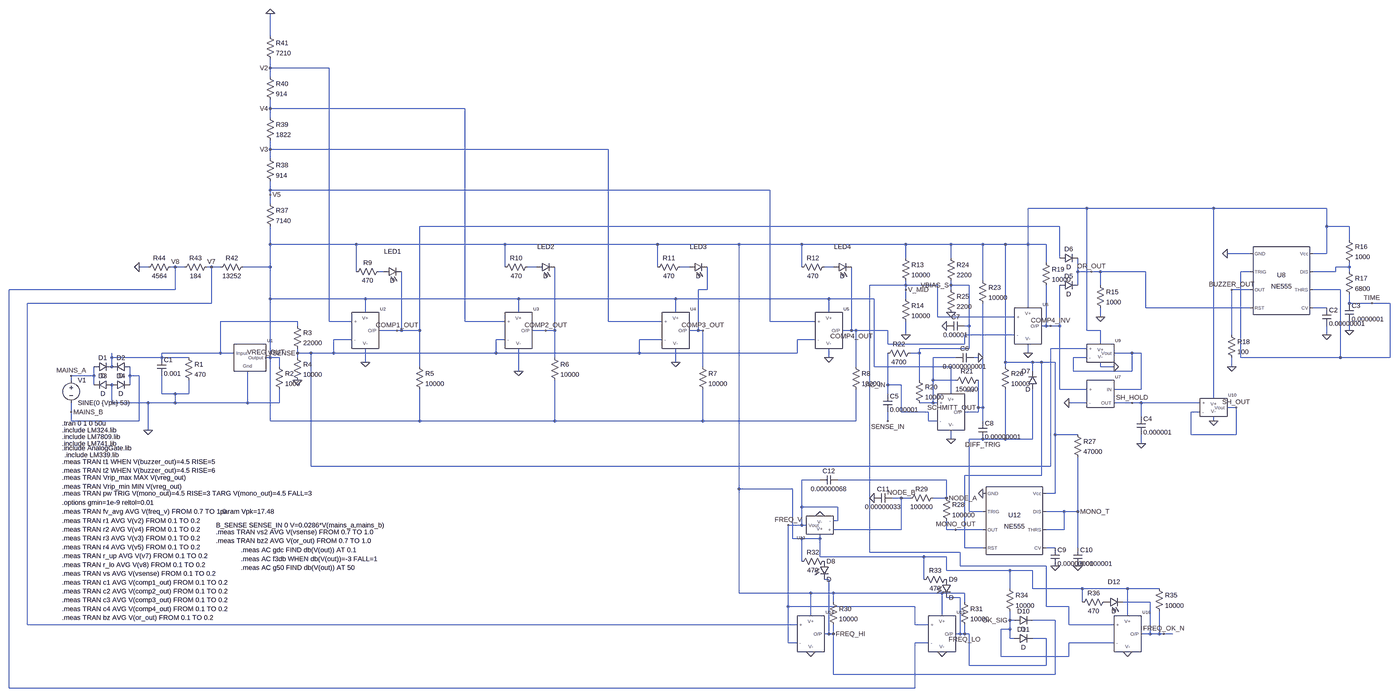
[diagram p0: schematic LIC_LabProject.asc, whole sheet]
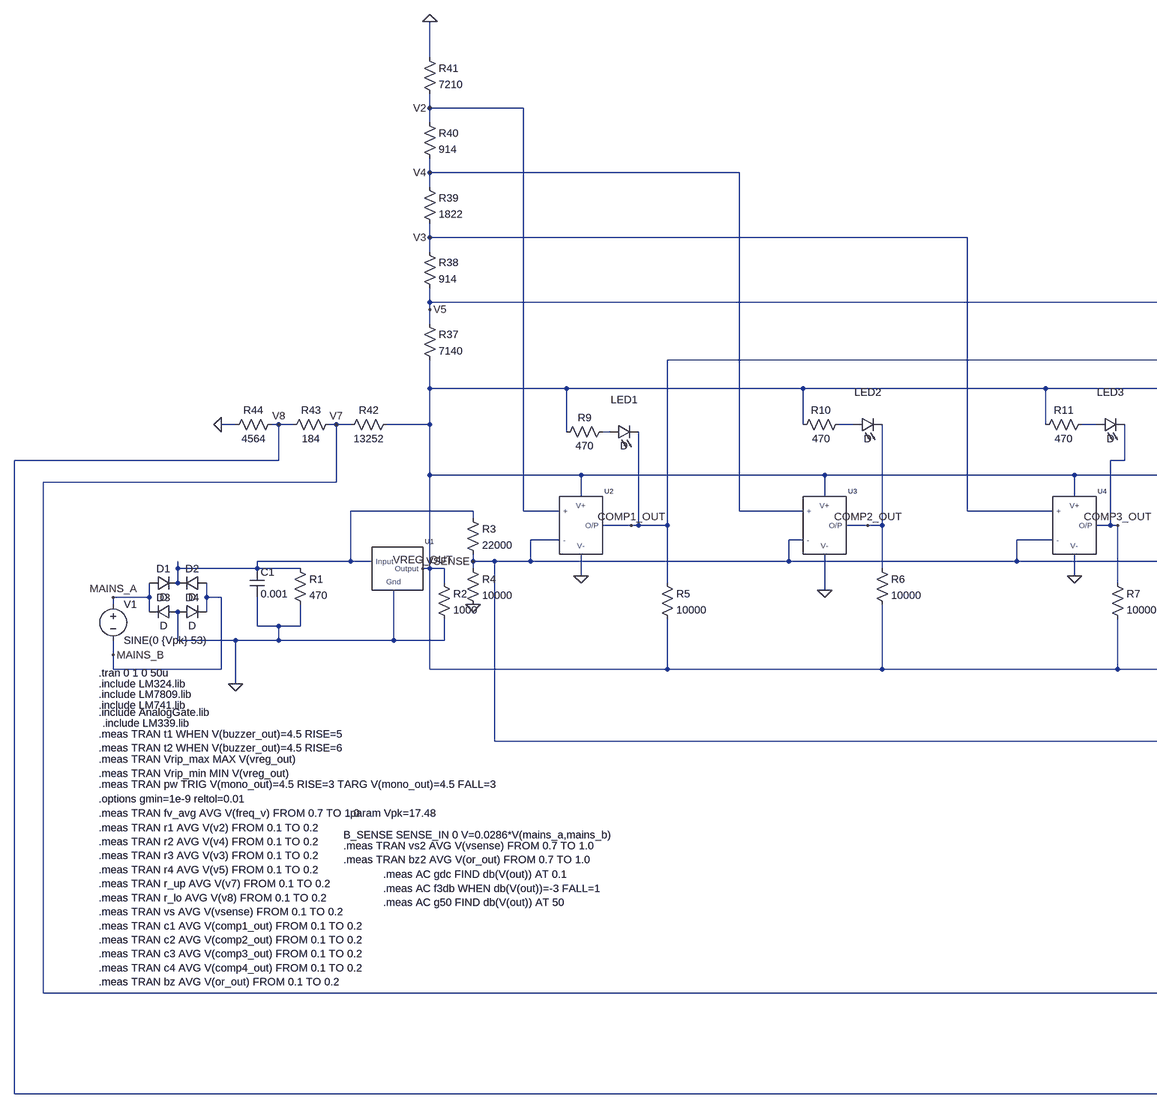
[diagram p1: schematic LIC_LabProject.asc, part, row 1 of 1, column 1 of 2]
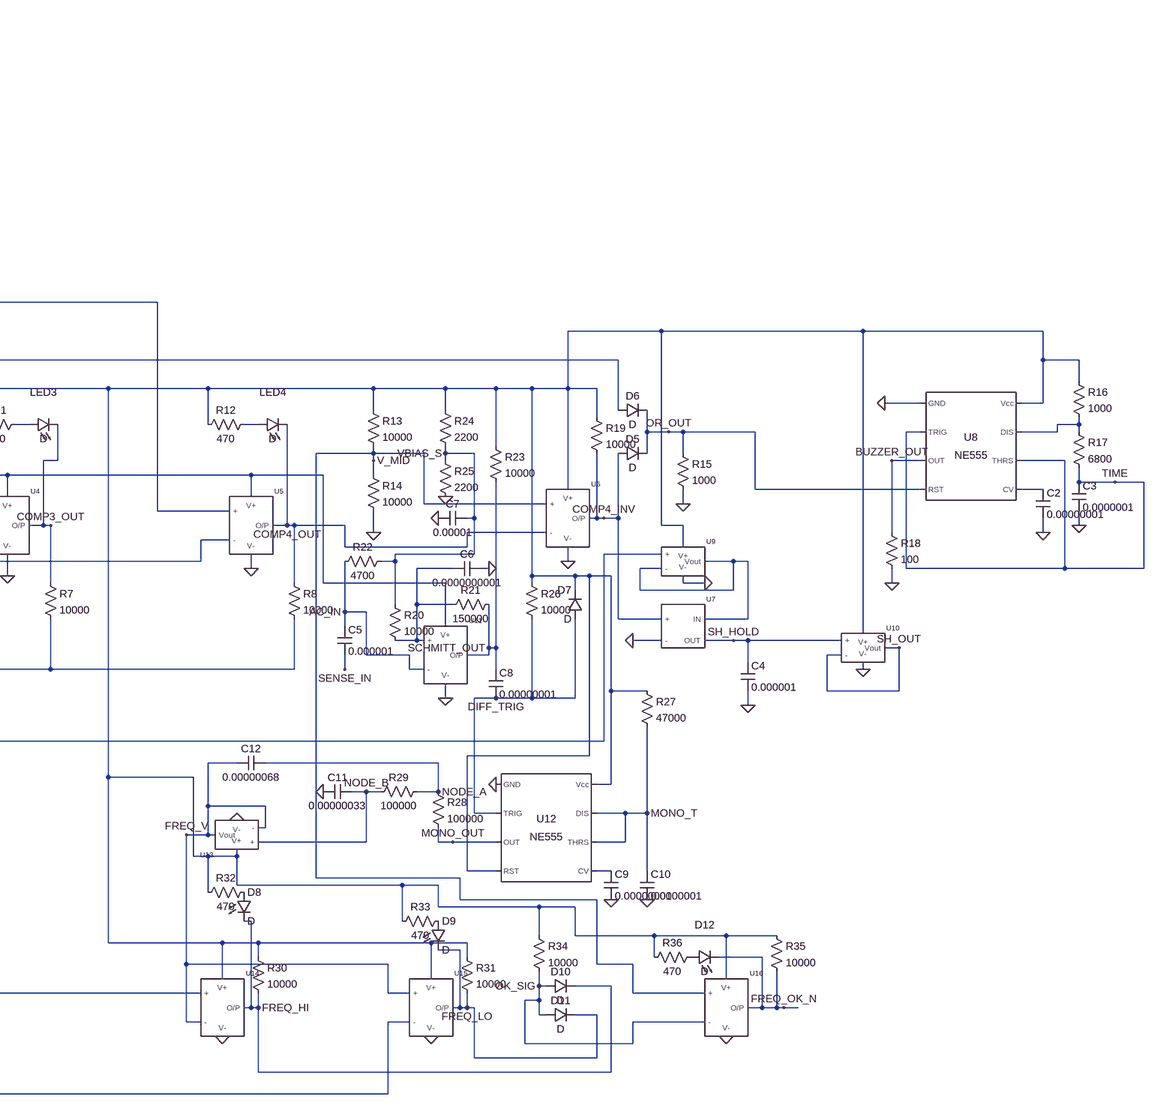
[diagram p2: schematic LIC_LabProject.asc, part, row 1 of 1, column 2 of 2]
LIC_LabProject.asc, the LTspice schematic file:
Version 4.1
SHEET 1 4772 1204
WIRE 736 -1104 736 -1184
WIRE 736 -992 736 -1024
WIRE 944 -992 736 -992
WIRE 736 -960 736 -992
WIRE 736 -848 736 -880
WIRE 1424 -848 736 -848
WIRE 736 -816 736 -848
WIRE 736 -704 736 -736
WIRE 1984 -704 736 -704
WIRE 736 -672 736 -704
WIRE 736 -560 736 -592
WIRE 2576 -560 736 -560
WIRE 736 -544 736 -560
WIRE 736 -512 736 -544
WIRE 3696 -496 3488 -496
WIRE 4144 -496 3696 -496
WIRE 4544 -496 4144 -496
WIRE 3600 -432 1264 -432
WIRE 4544 -432 4544 -496
WIRE 4624 -432 4544 -432
WIRE 4624 -384 4624 -432
WIRE 736 -368 736 -432
WIRE 1040 -368 736 -368
WIRE 1584 -368 1040 -368
WIRE 2160 -368 1584 -368
WIRE 2448 -368 2160 -368
WIRE 2688 -368 2448 -368
WIRE 3056 -368 2688 -368
WIRE 3216 -368 3056 -368
WIRE 3328 -368 3216 -368
WIRE 3408 -368 3328 -368
WIRE 3488 -368 3488 -496
WIRE 3488 -368 3408 -368
WIRE 3552 -368 3488 -368
WIRE 4272 -336 4192 -336
WIRE 4544 -336 4544 -432
WIRE 4544 -336 4496 -336
WIRE 3056 -320 3056 -368
WIRE 3216 -320 3216 -368
WIRE 3600 -320 3600 -432
WIRE 3552 -304 3552 -368
WIRE 304 -288 272 -288
WIRE 400 -288 384 -288
WIRE 432 -288 400 -288
WIRE 528 -288 512 -288
WIRE 560 -288 528 -288
WIRE 736 -288 736 -368
WIRE 736 -288 640 -288
WIRE 1584 -288 1584 -368
WIRE 1696 -288 1664 -288
WIRE 2160 -288 2160 -368
WIRE 2272 -288 2240 -288
WIRE 2688 -288 2688 -368
WIRE 2800 -288 2768 -288
WIRE 4624 -288 4624 -304
WIRE 4624 -288 4576 -288
WIRE 1040 -272 1040 -368
WIRE 1136 -272 1120 -272
WIRE 3664 -272 3664 -320
WIRE 3712 -272 3664 -272
WIRE 3744 -272 3712 -272
WIRE 3904 -272 3744 -272
WIRE 4272 -272 4240 -272
WIRE 4576 -272 4576 -288
WIRE 4576 -272 4496 -272
WIRE 4624 -272 4624 -288
WIRE 3328 -240 3328 -368
WIRE 3056 -224 3056 -240
WIRE 3056 -224 2928 -224
WIRE 3168 -224 3056 -224
WIRE 3216 -224 3216 -240
WIRE 3280 -224 3216 -224
WIRE 3664 -224 3664 -272
WIRE 3744 -224 3744 -272
WIRE 400 -208 400 -288
WIRE 400 -208 -256 -208
WIRE 2336 -208 2336 -288
WIRE 2336 -208 2304 -208
WIRE 3056 -208 3056 -224
WIRE 3216 -208 3216 -224
WIRE 4272 -208 4208 -208
WIRE 4592 -208 4496 -208
WIRE 736 -176 736 -288
WIRE 1072 -176 736 -176
WIRE 1632 -176 1072 -176
WIRE 2224 -176 1632 -176
WIRE 2784 -176 2224 -176
WIRE 2944 -176 2784 -176
WIRE 3056 -176 3056 -208
WIRE 528 -160 528 -288
WIRE 528 -160 -192 -160
WIRE 4624 -160 4624 -192
WIRE 4704 -160 4624 -160
WIRE 4768 -160 4704 -160
WIRE 3488 -144 3488 -368
WIRE 3904 -144 3904 -272
WIRE 4272 -144 3904 -144
WIRE 4544 -144 4496 -144
WIRE 1072 -128 1072 -176
WIRE 1632 -128 1632 -176
WIRE 2224 -128 2224 -176
WIRE 2784 -128 2784 -176
WIRE 3168 -112 3168 -224
WIRE 3440 -112 3168 -112
WIRE 3744 -112 3744 -144
WIRE 832 -96 560 -96
WIRE 944 -96 944 -992
WIRE 1024 -96 944 -96
WIRE 1424 -96 1424 -848
WIRE 1584 -96 1424 -96
WIRE 1984 -96 1984 -704
WIRE 2176 -96 1984 -96
WIRE 2576 -96 2576 -560
WIRE 2736 -96 2576 -96
WIRE 832 -80 832 -96
WIRE 3280 -80 3280 -224
WIRE 3280 -80 3264 -80
WIRE 3552 -80 3552 -224
WIRE 3552 -80 3536 -80
WIRE 3568 -80 3552 -80
WIRE 3600 -80 3600 -224
WIRE 3600 -80 3568 -80
WIRE 1184 -64 1120 -64
WIRE 1200 -64 1200 -272
WIRE 1200 -64 1184 -64
WIRE 1264 -64 1264 -432
WIRE 1264 -64 1200 -64
WIRE 1728 -64 1680 -64
WIRE 1760 -64 1760 -288
WIRE 1760 -64 1728 -64
WIRE 2304 -64 2304 -208
WIRE 2304 -64 2272 -64
WIRE 2320 -64 2304 -64
WIRE 2864 -64 2864 -288
WIRE 2864 -64 2832 -64
WIRE 2880 -64 2864 -64
WIRE 2992 -64 2880 -64
WIRE 3696 -64 3696 -496
WIRE 3744 -64 3696 -64
WIRE 4624 -64 4624 -96
WIRE 3056 -48 3056 -96
WIRE 3440 -48 3264 -48
WIRE 4208 -48 4208 -208
WIRE 4544 -48 4544 -80
WIRE 1024 -32 960 -32
WIRE 1584 -32 1552 -32
WIRE 2176 -32 2096 -32
WIRE 2736 -32 2672 -32
WIRE 2992 -16 2992 -64
WIRE 3264 -16 3264 -48
WIRE 3264 -16 2992 -16
WIRE 3744 -16 3744 -64
WIRE 3280 0 3280 -80
WIRE 3280 0 3104 0
WIRE 3696 0 3568 0
WIRE 560 16 560 -96
WIRE 560 16 352 16
WIRE 608 16 560 16
WIRE 832 16 832 0
WIRE 880 16 832 16
WIRE 960 16 960 -32
WIRE 960 16 880 16
WIRE 1552 16 1552 -32
WIRE 1552 16 960 16
WIRE 2096 16 2096 -32
WIRE 2096 16 1552 16
WIRE 2672 16 2672 -32
WIRE 2672 16 2096 16
WIRE 3104 16 3104 0
WIRE 3104 16 3072 16
WIRE 3488 16 3488 -16
WIRE 3856 16 3792 16
WIRE 3888 16 3856 16
WIRE 176 32 176 16
WIRE 352 32 352 16
WIRE 352 32 176 32
WIRE 448 32 352 32
WIRE 736 32 736 -176
WIRE 736 32 720 32
WIRE 768 32 736 32
WIRE 832 32 832 16
WIRE 1760 32 1760 -64
WIRE 2784 32 2784 0
WIRE 3232 32 3152 32
WIRE 3312 32 3296 32
WIRE 3696 32 3648 32
WIRE 4240 32 4240 -272
WIRE 4592 32 4592 -208
WIRE 4592 32 4240 32
WIRE 4768 32 4768 -160
WIRE 4768 32 4592 32
WIRE 1072 48 1072 0
WIRE 2224 48 2224 0
WIRE 3408 48 3408 -368
WIRE 3504 48 3408 48
WIRE 3536 48 3504 48
WIRE 3584 48 3536 48
WIRE 176 64 176 32
WIRE 768 64 768 32
WIRE 1264 64 1264 -64
WIRE 2320 64 2320 -64
WIRE 2880 64 2880 -64
WIRE 2944 64 2944 -176
WIRE 3216 64 2944 64
WIRE 3408 64 3408 48
WIRE 3744 64 3744 48
WIRE 3792 64 3744 64
WIRE 4208 64 4208 32
WIRE 1632 80 1632 0
WIRE 3504 80 3504 48
WIRE 3648 80 3648 32
WIRE 3856 80 3856 16
WIRE 3856 80 3648 80
WIRE 112 96 112 64
WIRE 112 96 32 96
WIRE 240 96 240 64
WIRE 272 96 240 96
WIRE 32 112 32 96
WIRE 3104 112 3104 16
WIRE 3152 112 3152 32
WIRE 3232 112 3152 112
WIRE 112 128 112 96
WIRE 240 128 240 96
WIRE 2992 128 2992 16
WIRE 3040 128 2992 128
WIRE 3600 144 3600 -80
WIRE 3696 144 3600 144
WIRE 3888 144 3888 16
WIRE 3888 144 3792 144
WIRE 352 160 352 96
WIRE 400 160 352 160
WIRE 448 160 448 112
WIRE 448 160 400 160
WIRE 2992 160 2992 128
WIRE 3216 160 3216 64
WIRE 4144 176 4144 -496
WIRE 176 192 176 128
WIRE 304 192 176 192
WIRE 400 192 400 160
WIRE 400 192 304 192
WIRE 656 192 656 80
WIRE 656 192 400 192
WIRE 768 192 768 144
WIRE 768 192 656 192
WIRE 3152 192 3152 112
WIRE 3152 192 3104 192
WIRE 3168 192 3152 192
WIRE 3696 192 3632 192
WIRE 3856 192 3792 192
WIRE 3888 192 3856 192
WIRE 4096 192 3888 192
WIRE 3312 208 3312 112
WIRE 3328 208 3328 -160
WIRE 3328 208 3312 208
WIRE 4224 208 4192 208
WIRE 32 224 32 192
WIRE 3040 224 3040 128
WIRE 3136 224 3040 224
WIRE 3312 224 3312 208
WIRE 3312 224 3264 224
WIRE 4096 224 4064 224
WIRE 3888 240 3888 192
WIRE 32 256 32 224
WIRE 272 256 272 96
WIRE 272 256 32 256
WIRE 736 256 736 32
WIRE 1264 256 1264 144
WIRE 1264 256 736 256
WIRE 1760 256 1760 112
WIRE 1760 256 1264 256
WIRE 2320 256 2320 144
WIRE 2320 256 1760 256
WIRE 2880 256 2880 144
WIRE 2880 256 2320 256
WIRE 2992 256 2992 224
WIRE 3136 256 3136 224
WIRE 3168 256 3136 256
WIRE 3328 256 3328 208
WIRE 4144 256 4144 240
WIRE 304 288 304 192
WIRE 3584 304 3584 48
WIRE 3664 304 3584 304
WIRE 4064 304 4064 224
WIRE 4224 304 4224 208
WIRE 4224 304 4064 304
WIRE 3216 320 3216 288
WIRE 3328 320 3280 320
WIRE 3408 320 3408 144
WIRE 3408 320 3328 320
WIRE 3504 320 3504 144
WIRE 3504 320 3408 320
WIRE 3888 336 3888 304
WIRE 880 416 880 16
WIRE 3568 416 3568 0
WIRE 3568 416 880 416
WIRE 3536 448 3536 48
WIRE 3536 448 3264 448
WIRE 2752 464 2688 464
WIRE 3200 464 2816 464
WIRE 2448 496 2448 -368
WIRE 2656 496 2448 496
WIRE 3584 512 3584 304
WIRE 3584 512 3552 512
WIRE 3040 528 3008 528
WIRE 3072 528 3040 528
WIRE 3200 528 3200 464
WIRE 3200 528 3152 528
WIRE 2688 560 2688 464
WIRE 2816 560 2688 560
WIRE 3280 576 3280 320
WIRE 3328 576 3280 576
WIRE 3616 576 3552 576
WIRE 3664 576 3664 384
WIRE 3664 576 3616 576
WIRE 2816 608 2816 560
WIRE 2816 608 2800 608
WIRE 2688 624 2688 560
WIRE 2688 624 2640 624
WIRE 2704 624 2688 624
WIRE 3040 640 3040 528
WIRE 3040 640 2800 640
WIRE 3200 640 3200 608
WIRE 3232 640 3200 640
WIRE 3328 640 3232 640
WIRE 3616 640 3616 576
WIRE 3616 640 3552 640
WIRE 2656 672 2656 496
WIRE 2688 672 2656 672
WIRE 2752 672 2752 656
WIRE 2752 672 2688 672
WIRE 3264 704 3264 448
WIRE 3328 704 3264 704
WIRE 3584 704 3552 704
WIRE 3664 704 3664 576
WIRE 2928 720 2928 -224
WIRE 3248 720 2928 720
WIRE 2752 736 2752 672
WIRE 3120 736 2752 736
WIRE 3200 736 3120 736
WIRE 2688 752 2688 672
WIRE 3248 768 3248 720
WIRE 3552 768 3248 768
WIRE 3200 784 3200 736
WIRE 3424 784 3200 784
WIRE 3504 784 3424 784
WIRE 2784 816 2768 816
WIRE 3120 816 3120 736
WIRE 3424 848 3424 784
WIRE 3504 848 3504 784
WIRE 3680 848 3504 848
WIRE 3840 848 3680 848
WIRE 3952 848 3840 848
WIRE 2448 864 2448 496
WIRE 2720 864 2448 864
WIRE 2800 864 2720 864
WIRE 3184 864 2800 864
WIRE 3264 864 3184 864
WIRE 3248 880 3200 880
WIRE 2800 896 2800 864
WIRE 3264 896 3264 864
WIRE 3680 896 3680 848
WIRE 3920 896 3824 896
WIRE 2640 912 2640 624
WIRE 3088 912 2640 912
WIRE 3552 912 3552 768
WIRE 3632 912 3552 912
WIRE 2720 944 2720 864
WIRE 3184 944 3184 864
WIRE 3840 944 3840 848
WIRE 3424 960 3424 928
WIRE 3440 960 3424 960
WIRE 3584 960 3504 960
WIRE -192 976 -192 -160
WIRE 2672 976 -192 976
WIRE 3088 976 3088 912
WIRE 3136 976 3088 976
WIRE 3632 976 3632 912
WIRE 3792 976 3632 976
WIRE 3424 992 3424 960
WIRE 3424 992 3392 992
WIRE 2784 1008 2784 816
WIRE 2784 1008 2768 1008
WIRE 2800 1008 2800 976
WIRE 2800 1008 2784 1008
WIRE 3248 1008 3248 880
WIRE 3248 1008 3232 1008
WIRE 3264 1008 3264 976
WIRE 3264 1008 3248 1008
WIRE 3280 1008 3264 1008
WIRE 3920 1008 3920 896
WIRE 3920 1008 3888 1008
WIRE 3952 1008 3952 928
WIRE 3952 1008 3920 1008
WIRE 3968 1008 3952 1008
WIRE 4000 1008 3968 1008
WIRE 3424 1024 3424 992
WIRE 3440 1024 3424 1024
WIRE 3552 1024 3504 1024
WIRE 2640 1040 2640 912
WIRE 2672 1040 2640 1040
WIRE 3136 1040 3088 1040
WIRE 3792 1040 3632 1040
WIRE 3392 1088 3392 992
WIRE 3632 1088 3632 1040
WIRE 3632 1088 3392 1088
WIRE 3280 1120 3280 1008
WIRE 3552 1120 3552 1024
WIRE 3552 1120 3280 1120
WIRE 2800 1152 2800 1008
WIRE 3584 1152 3584 960
WIRE 3584 1152 2800 1152
WIRE -256 1200 -256 -208
WIRE 3088 1200 3088 1040
WIRE 3088 1200 -256 1200
FLAG 304 288 0
FLAG 832 112 0
FLAG 832 16 VSENSE
FLAG 1072 48 0
FLAG 1184 -64 COMP1_OUT
FLAG 720 32 VREG_OUT
FLAG 1632 80 0
FLAG 1728 -64 COMP2_OUT
FLAG 2784 32 0
FLAG 2224 48 0
FLAG 2320 -64 COMP3_OUT
FLAG 2864 -64 COMP4_OUT
FLAG 3056 -48 0
FLAG 3056 -208 V_MID
FLAG 3488 16 0
FLAG 3568 -80 COMP4_INV
FLAG 3744 -112 0
FLAG 3712 -272 OR_OUT
FLAG 4192 -336 0
FLAG 4544 -48 0
FLAG 4208 64 0
FLAG 4624 -64 0
FLAG 4704 -160 TIME
FLAG 4208 -208 BUZZER_OUT
FLAG 3632 192 0
FLAG 3792 64 0
FLAG 3856 192 SH_HOLD
FLAG 3888 336 0
FLAG 4144 256 0
FLAG 4224 208 SH_OUT
FLAG 2992 128 AC_IN
FLAG 3312 208 SCHMITT_OUT
FLAG 3216 320 0
FLAG 3312 32 0
FLAG 3216 -128 0
FLAG 3216 -224 VBIAS_S
FLAG 3200 -80 0
FLAG 3232 640 MONO_OUT
FLAG 3328 320 DIFF_TRIG
FLAG 3584 768 0
FLAG 3328 512 0
FLAG 3664 768 0
FLAG 3664 576 MONO_T
FLAG 3200 528 NODE_A
FLAG 3040 528 NODE_B
FLAG 2944 528 0
FLAG 2640 624 FREQ_V
FLAG 2752 592 0
FLAG 2720 1072 0
FLAG 3184 1072 0
FLAG 2800 1008 FREQ_HI
FLAG 3264 1008 FREQ_LO
FLAG 3424 960 OK_SIG
FLAG 3840 1072 0
FLAG 3968 1008 FREQ_OK_N
FLAG 736 -1184 0
FLAG 736 -544 V5
FLAG 736 -704 V3
FLAG 736 -848 V4
FLAG 736 -992 V2
FLAG 272 -288 0
FLAG 528 -288 V7
FLAG 400 -288 V8
FLAG 32 96 MAINS_A
FLAG 32 224 MAINS_B
FLAG 2992 256 SENSE_IN
SYMBOL voltage 32 96 R0
WINDOW 123 0 0 Left 0
WINDOW 39 0 0 Left 0
SYMATTR InstName V1
SYMATTR Value SINE(0 {Vpk} 53)
SYMBOL diode 112 80 R270
WINDOW 0 32 32 VTop 2
WINDOW 3 0 32 VBottom 2
SYMATTR InstName D1
SYMBOL diode 240 48 R90
WINDOW 0 0 32 VBottom 2
WINDOW 3 32 32 VTop 2
SYMATTR InstName D2
SYMBOL diode 176 112 R90
WINDOW 0 0 32 VBottom 2
WINDOW 3 32 32 VTop 2
SYMATTR InstName D3
SYMBOL diode 176 144 R270
WINDOW 0 32 32 VTop 2
WINDOW 3 0 32 VBottom 2
SYMATTR InstName D4
SYMBOL cap 336 32 R0
SYMATTR InstName C1
SYMATTR Value 0.001
SYMBOL res 432 16 R0
SYMATTR InstName R1
SYMATTR Value 470
SYMBOL LM7809 656 32 R0
SYMATTR InstName U1
SYMBOL res 816 -96 R0
SYMATTR InstName R3
SYMATTR Value 22000
SYMBOL res 816 16 R0
SYMATTR InstName R4
SYMATTR Value 10000
SYMBOL LM339 1072 -64 R0
SYMATTR InstName U2
SYMBOL LM339 1632 -64 R0
SYMATTR InstName U3
SYMBOL res 1744 16 R0
SYMATTR InstName R6
SYMATTR Value 10000
SYMBOL res 752 48 R0
SYMATTR InstName R2
SYMATTR Value 1000
SYMBOL res 1248 48 R0
SYMATTR InstName R5
SYMATTR Value 10000
SYMBOL LM339 2224 -64 R0
SYMATTR InstName U4
SYMBOL LM339 2784 -64 R0
SYMATTR InstName U5
SYMBOL res 2304 48 R0
SYMATTR InstName R7
SYMATTR Value 10000
SYMBOL res 2864 48 R0
SYMATTR InstName R8
SYMATTR Value 10000
SYMBOL res 1136 -288 R90
WINDOW 0 0 56 VBottom 2
WINDOW 3 32 56 VTop 2
SYMATTR InstName R9
SYMATTR Value 470
SYMBOL res 1680 -304 R90
WINDOW 0 0 56 VBottom 2
WINDOW 3 32 56 VTop 2
SYMATTR InstName R10
SYMATTR Value 470
SYMBOL res 2256 -304 R90
WINDOW 0 0 56 VBottom 2
WINDOW 3 32 56 VTop 2
SYMATTR InstName R11
SYMATTR Value 470
SYMBOL res 2784 -304 R90
WINDOW 0 0 56 VBottom 2
WINDOW 3 32 56 VTop 2
SYMATTR InstName R12
SYMATTR Value 470
SYMBOL LED 1136 -256 R270
WINDOW 0 72 32 VTop 2
WINDOW 3 0 32 VBottom 2
SYMATTR InstName LED1
SYMBOL LED 1696 -272 R270
WINDOW 0 72 32 VTop 2
WINDOW 3 0 32 VBottom 2
SYMATTR InstName LED2
SYMBOL LED 2272 -272 R270
WINDOW 0 72 32 VTop 2
WINDOW 3 0 32 VBottom 2
SYMATTR InstName LED3
SYMBOL LED 2800 -272 R270
WINDOW 0 72 32 VTop 2
WINDOW 3 0 32 VBottom 2
SYMATTR InstName LED4
SYMBOL res 3040 -336 R0
SYMATTR InstName R13
SYMATTR Value 10000
SYMBOL res 3040 -192 R0
SYMATTR InstName R14
SYMATTR Value 10000
SYMBOL LM339 3488 -80 R0
SYMATTR InstName U6
SYMBOL diode 3600 -208 R270
WINDOW 0 32 32 VTop 2
WINDOW 3 0 32 VBottom 2
SYMATTR InstName D5
SYMBOL diode 3600 -304 R270
WINDOW 0 32 32 VTop 2
WINDOW 3 0 32 VBottom 2
SYMATTR InstName D6
SYMBOL res 3728 -240 R0
SYMATTR InstName R15
SYMATTR Value 1000
SYMBOL Misc\\NE555 4384 -240 R0
SYMATTR InstName U8
SYMBOL res 4608 -400 R0
SYMATTR InstName R16
SYMATTR Value 1000
SYMBOL res 4608 -288 R0
SYMATTR InstName R17
SYMATTR Value 6800
SYMBOL cap 4528 -144 R0
SYMATTR InstName C2
SYMATTR Value 0.00000001
SYMBOL res 4192 -64 R0
SYMATTR InstName R18
SYMATTR Value 100
SYMBOL cap 4608 -160 R0
SYMATTR InstName C3
SYMATTR Value 0.0000001
SYMBOL LM324 3744 16 R0
SYMATTR InstName U9
SYMBOL cap 3872 240 R0
SYMATTR InstName C4
SYMATTR Value 0.000001
SYMBOL LM324 4144 208 R0
SYMATTR InstName U10
SYMBOL AnalogGate 3744 160 R0
SYMATTR InstName U7
SYMBOL res 3536 -320 R0
SYMATTR InstName R19
SYMATTR Value 10000
SYMBOL cap 2976 160 R0
SYMATTR InstName C5
SYMATTR Value 0.000001
SYMBOL res 3088 96 R0
SYMATTR InstName R20
SYMATTR Value 10000
SYMBOL res 3328 96 R90
WINDOW 0 0 56 VBottom 2
WINDOW 3 32 56 VTop 2
SYMATTR InstName R21
SYMATTR Value 150000
SYMBOL res 3088 0 R90
WINDOW 0 0 56 VBottom 2
WINDOW 3 32 56 VTop 2
SYMATTR InstName R22
SYMATTR Value 4700
SYMBOL LM339 3216 224 R0
SYMATTR InstName U11
SYMBOL res 3312 -256 R0
SYMATTR InstName R23
SYMATTR Value 10000
SYMBOL cap 3296 16 R90
WINDOW 0 0 32 VBottom 2
WINDOW 3 32 32 VTop 2
SYMATTR InstName C6
SYMATTR Value 0.0000000001
SYMBOL res 3200 -336 R0
SYMATTR InstName R24
SYMATTR Value 2200
SYMBOL res 3200 -224 R0
SYMATTR InstName R25
SYMATTR Value 2200
SYMBOL cap 3264 -96 R90
WINDOW 0 0 32 VBottom 2
WINDOW 3 32 32 VTop 2
SYMATTR InstName C7
SYMATTR Value 0.00001
SYMBOL Misc\\NE555 3440 608 R0
SYMATTR InstName U12
SYMBOL res 3392 48 R0
SYMATTR InstName R26
SYMATTR Value 10000
SYMBOL diode 3520 144 R180
WINDOW 0 24 64 Left 2
WINDOW 3 24 0 Left 2
SYMATTR InstName D7
SYMBOL cap 3312 256 R0
SYMATTR InstName C8
SYMATTR Value 0.00000001
SYMBOL cap 3568 704 R0
SYMATTR InstName C9
SYMATTR Value 0.00000001
SYMBOL res 3648 288 R0
SYMATTR InstName R27
SYMATTR Value 47000
SYMBOL cap 3648 704 R0
SYMATTR InstName C10
SYMATTR Value 0.0000001
SYMBOL LM324 2752 624 R180
SYMATTR InstName U13
SYMBOL res 3184 512 R0
SYMATTR InstName R28
SYMATTR Value 100000
SYMBOL res 3168 512 R90
WINDOW 0 0 56 VBottom 2
WINDOW 3 32 56 VTop 2
SYMATTR InstName R29
SYMATTR Value 100000
SYMBOL cap 3008 512 R90
WINDOW 0 0 32 VBottom 2
WINDOW 3 32 32 VTop 2
SYMATTR InstName C11
SYMATTR Value 0.00000033
SYMBOL cap 2816 448 R90
WINDOW 0 0 32 VBottom 2
WINDOW 3 32 32 VTop 2
SYMATTR InstName C12
SYMATTR Value 0.00000068
SYMBOL LM339 2720 1008 R0
SYMATTR InstName U14
SYMBOL LM339 3184 1008 R0
SYMATTR InstName U15
SYMBOL res 2784 880 R0
SYMATTR InstName R30
SYMATTR Value 10000
SYMBOL res 3248 880 R0
SYMATTR InstName R31
SYMATTR Value 10000
SYMBOL res 3216 800 R90
WINDOW 0 0 56 VBottom 2
WINDOW 3 32 56 VTop 2
SYMATTR InstName R33
SYMATTR Value 470
SYMBOL LED 3184 816 R0
SYMATTR InstName D9
SYMBOL res 2784 736 R90
WINDOW 0 0 56 VBottom 2
WINDOW 3 32 56 VTop 2
SYMATTR InstName R32
SYMATTR Value 470
SYMBOL LED 2752 752 R0
SYMATTR InstName D8
SYMBOL res 3408 832 R0
SYMATTR InstName R34
SYMATTR Value 10000
SYMBOL diode 3440 976 R270
WINDOW 0 32 32 VTop 2
WINDOW 3 0 32 VBottom 2
SYMATTR InstName D10
SYMBOL diode 3440 1040 R270
WINDOW 0 32 32 VTop 2
WINDOW 3 0 32 VBottom 2
SYMATTR InstName D11
SYMBOL LM339 3840 1008 R0
SYMATTR InstName U16
SYMBOL res 3936 832 R0
SYMATTR InstName R35
SYMATTR Value 10000
SYMBOL res 3776 880 R90
WINDOW 0 0 56 VBottom 2
WINDOW 3 32 56 VTop 2
SYMATTR InstName R36
SYMATTR Value 470
SYMBOL LED 3760 912 R270
WINDOW 0 72 32 VTop 2
WINDOW 3 0 32 VBottom 2
SYMATTR InstName D12
SYMBOL res 720 -528 R0
SYMATTR InstName R37
SYMATTR Value 7140
SYMBOL res 720 -688 R0
SYMATTR InstName R38
SYMATTR Value 914
SYMBOL res 720 -832 R0
SYMATTR InstName R39
SYMATTR Value 1822
SYMBOL res 720 -976 R0
SYMATTR InstName R40
SYMATTR Value 914
SYMBOL res 720 -1120 R0
SYMATTR InstName R41
SYMATTR Value 7210
SYMBOL res 656 -304 R90
WINDOW 0 0 56 VBottom 2
WINDOW 3 32 56 VTop 2
SYMATTR InstName R42
SYMATTR Value 13252
SYMBOL res 528 -304 R90
WINDOW 0 0 56 VBottom 2
WINDOW 3 32 56 VTop 2
SYMATTR InstName R43
SYMATTR Value 184
SYMBOL res 400 -304 R90
WINDOW 0 0 56 VBottom 2
WINDOW 3 32 56 VTop 2
SYMATTR InstName R44
SYMATTR Value 4564
TEXT 0 264 Left 2 !.tran 0 1 0 50u
TEXT 0 288 Left 2 !.include LM324.lib
TEXT 0 312 Left 2 !.include LM7809.lib
TEXT 0 336 Left 2 !.include LM741.lib
TEXT 8 376 Left 2 !.include LM339.lib
TEXT 0 456 Left 2 !.meas TRAN Vrip_max MAX V(vreg_out)\n.meas TRAN Vrip_min MIN V(vreg_out)
TEXT 0 400 Left 2 !.meas TRAN t1 WHEN V(buzzer_out)=4.5 RISE=5\n.meas TRAN t2 WHEN V(buzzer_out)=4.5 RISE=6
TEXT 0 352 Left 2 !.include AnalogGate.lib
TEXT 0 544 Left 2 !.options gmin=1e-9 reltol=0.01
TEXT 0 512 Left 2 !.meas TRAN pw TRIG V(mono_out)=4.5 RISE=3 TARG V(mono_out)=4.5 FALL=3
TEXT 0 576 Left 2 !.meas TRAN fv_avg AVG V(freq_v) FROM 0.7 TO 1.0
TEXT 0 608 Left 2 !.meas TRAN r1 AVG V(v2) FROM 0.1 TO 0.2\n.meas TRAN r2 AVG V(v4) FROM 0.1 TO 0.2\n.meas TRAN r3 AVG V(v3) FROM 0.1 TO 0.2\n.meas TRAN r4 AVG V(v5) FROM 0.1 TO 0.2\n.meas TRAN r_up AVG V(v7) FROM 0.1 TO 0.2\n.meas TRAN r_lo AVG V(v8) FROM 0.1 TO 0.2\n.meas TRAN vs AVG V(vsense) FROM 0.1 TO 0.2\n.meas TRAN c1 AVG V(comp1_out) FROM 0.1 TO 0.2\n.meas TRAN c2 AVG V(comp2_out) FROM 0.1 TO 0.2\n.meas TRAN c3 AVG V(comp3_out) FROM 0.1 TO 0.2\n.meas TRAN c4 AVG V(comp4_out) FROM 0.1 TO 0.2\n.meas TRAN bz AVG V(or_out) FROM 0.1 TO 0.2
TEXT 552 576 Left 2 !.param Vpk=17.48
TEXT 544 624 Left 2 !B_SENSE SENSE_IN 0 V=0.0286*V(mains_a,mains_b)
TEXT 544 648 Left 2 !.meas TRAN vs2 AVG V(vsense) FROM 0.7 TO 1.0\n.meas TRAN bz2 AVG V(or_out) FROM 0.7 TO 1.0
TEXT 632 712 Left 2 !.meas AC gdc FIND db(V(out)) AT 0.1\n.meas AC f3db WHEN db(V(out))=-3 FALL=1\n.meas AC g50 FIND db(V(out)) AT 50

The netlist it stands for:
* LIC_LabProject.asc
V1 MAINS_A MAINS_B SINE(0 {Vpk} 53)
D1 MAINS_A N007 D
D2 MAINS_B N007 D
D3 0 MAINS_A D
D4 0 MAINS_B D
C1 N007 0 0.001
R1 N007 0 470
X§U1 N007 0 VREG_OUT LM7809  ; pins Input Gnd Output
R3 N007 VSENSE 22000
R4 VSENSE 0 10000
X§U2 V2 VSENSE VREG_OUT 0 COMP1_OUT LM339  ; pins + - V+ V- O/P
X§U3 V4 VSENSE VREG_OUT 0 COMP2_OUT LM339  ; pins + - V+ V- O/P
R6 COMP2_OUT VREG_OUT 10000
R2 VREG_OUT 0 1000
R5 COMP1_OUT VREG_OUT 10000
X§U4 V3 VSENSE VREG_OUT 0 COMP3_OUT LM339  ; pins + - V+ V- O/P
X§U5 V5 VSENSE VREG_OUT 0 COMP4_OUT LM339  ; pins + - V+ V- O/P
R7 COMP3_OUT VREG_OUT 10000
R8 COMP4_OUT VREG_OUT 10000
R9 N005 VREG_OUT 470
R10 N001 VREG_OUT 470
R11 N002 VREG_OUT 470
R12 N003 VREG_OUT 470
D§LED1 N005 COMP1_OUT D
D§LED2 N001 COMP2_OUT D
D§LED3 N002 COMP3_OUT D
D§LED4 N003 COMP4_OUT D
R13 VREG_OUT V_MID 10000
R14 V_MID 0 10000
X§U6 V_MID COMP4_OUT VREG_OUT 0 COMP4_INV LM339  ; pins + - V+ V- O/P
D5 COMP4_INV OR_OUT D
D6 COMP1_OUT OR_OUT D
R15 OR_OUT 0 1000
X§U8 0 TIME BUZZER_OUT OR_OUT N006 TIME N004 VREG_OUT NE555  ; pins GND TRIG OUT RST CV THRS DIS Vcc
R16 VREG_OUT N004 1000
R17 N004 TIME 6800
C2 N006 0 0.00000001
R18 BUZZER_OUT 0 100
C3 TIME 0 0.0000001
X§U9 VSENSE N008 VREG_OUT 0 N008 LM324  ; pins + - V+ V- Vout
C4 SH_HOLD 0 0.000001
X§U10 SH_HOLD SH_OUT VREG_OUT 0 SH_OUT LM324  ; pins + - V+ V- Vout
X§U7 COMP4_INV 0 N008 SH_HOLD AnalogGate  ; pins + - IN OUT
R19 VREG_OUT COMP4_INV 10000
C5 AC_IN SENSE_IN 0.000001
R20 VBIAS_S N009 10000
R21 SCHMITT_OUT N009 150000
R22 VBIAS_S AC_IN 4700
X§U11 N009 AC_IN VREG_OUT 0 SCHMITT_OUT LM339  ; pins + - V+ V- O/P
R23 VREG_OUT SCHMITT_OUT 10000
C6 0 N009 0.0000000001
R24 VREG_OUT VBIAS_S 2200
R25 VBIAS_S 0 2200
C7 VBIAS_S 0 0.00001
X§U12 0 DIFF_TRIG MONO_OUT VREG_OUT N010 MONO_T MONO_T VREG_OUT NE555  ; pins GND TRIG OUT RST CV THRS DIS Vcc
R26 VREG_OUT DIFF_TRIG 10000
D7 DIFF_TRIG VREG_OUT D
C8 SCHMITT_OUT DIFF_TRIG 0.00000001
C9 N010 0 0.00000001
R27 VREG_OUT MONO_T 47000
C10 MONO_T 0 0.0000001
X§U13 NODE_B FREQ_V VREG_OUT 0 FREQ_V LM324  ; pins + - V+ V- Vout
R28 NODE_A MONO_OUT 100000
R29 NODE_A NODE_B 100000
C11 NODE_B 0 0.00000033
C12 NODE_A FREQ_V 0.00000068
X§U14 V7 FREQ_V VREG_OUT 0 FREQ_HI LM339  ; pins + - V+ V- O/P
X§U15 FREQ_V V8 VREG_OUT 0 FREQ_LO LM339  ; pins + - V+ V- O/P
R30 VREG_OUT FREQ_HI 10000
R31 VREG_OUT FREQ_LO 10000
R33 P001 VREG_OUT 470
D9 P001 FREQ_LO D
R32 P002 VREG_OUT 470
D8 P002 FREQ_HI D
R34 VREG_OUT OK_SIG 10000
D10 OK_SIG FREQ_HI D
D11 OK_SIG FREQ_LO D
X§U16 V_MID OK_SIG VREG_OUT 0 FREQ_OK_N LM339  ; pins + - V+ V- O/P
R35 VREG_OUT FREQ_OK_N 10000
R36 P003 VREG_OUT 470
D12 P003 FREQ_OK_N D
R37 V5 VREG_OUT 7140
R38 V3 V5 914
R39 V4 V3 1822
R40 V2 V4 914
R41 0 V2 7210
R42 VREG_OUT V7 13252
R43 V7 V8 184
R44 V8 0 4564
.model D D
.lib standard.dio
.tran 0 1 0 50u
.include LM324.lib
.include LM7809.lib
.include LM741.lib
.include LM339.lib
.meas TRAN Vrip_max MAX V(vreg_out)
.meas TRAN Vrip_min MIN V(vreg_out)
.meas TRAN t1 WHEN V(buzzer_out)=4.5 RISE=5
.meas TRAN t2 WHEN V(buzzer_out)=4.5 RISE=6
.include AnalogGate.lib
.options gmin=1e-9 reltol=0.01
.meas TRAN pw TRIG V(mono_out)=4.5 RISE=3 TARG V(mono_out)=4.5 FALL=3
.meas TRAN fv_avg AVG V(freq_v) FROM 0.7 TO 1.0
.meas TRAN r1 AVG V(v2) FROM 0.1 TO 0.2
.meas TRAN r2 AVG V(v4) FROM 0.1 TO 0.2
.meas TRAN r3 AVG V(v3) FROM 0.1 TO 0.2
.meas TRAN r4 AVG V(v5) FROM 0.1 TO 0.2
.meas TRAN r_up AVG V(v7) FROM 0.1 TO 0.2
.meas TRAN r_lo AVG V(v8) FROM 0.1 TO 0.2
.meas TRAN vs AVG V(vsense) FROM 0.1 TO 0.2
.meas TRAN c1 AVG V(comp1_out) FROM 0.1 TO 0.2
.meas TRAN c2 AVG V(comp2_out) FROM 0.1 TO 0.2
.meas TRAN c3 AVG V(comp3_out) FROM 0.1 TO 0.2
.meas TRAN c4 AVG V(comp4_out) FROM 0.1 TO 0.2
.meas TRAN bz AVG V(or_out) FROM 0.1 TO 0.2
.param Vpk=17.48
B_SENSE SENSE_IN 0 V=0.0286*V(mains_a,mains_b)
.meas TRAN vs2 AVG V(vsense) FROM 0.7 TO 1.0
.meas TRAN bz2 AVG V(or_out) FROM 0.7 TO 1.0
.meas AC gdc FIND db(V(out)) AT 0.1
.meas AC f3db WHEN db(V(out))=-3 FALL=1
.meas AC g50 FIND db(V(out)) AT 50
.lib NE555.sub
.backanno
.end